# Altium schematic sheet DC116A_PwrMgmt.SchDoc: PwrMgmt
size 431 x 279 mm; Date: Not shown in title block; ApprovedBy: Not shown in title block; CheckedBy: Not shown in title block; Author: Not shown in title block; CompanyName: Not shown in title block; DrawnBy: Midhun Raveendran; Engineer: Midhun Raveendran; Organization: Not shown in title block; Address1: Not shown in title block; Address2: Not shown in title block; Address3: Not shown in title block; Address4: Not shown in title block; DocumentNumber: 6; Revision: Use project parameter SCH_Rev; SheetNumber: 6; SheetTotal: 8; PageSetup: Record=PageOptions|CenterHorizontal=True|CenterVertical=True|PrintScale=1.00|XCorrection=1.00|YCorrection=1.00|PrintKind=0|BorderSize=5000000|LeftOffset=0|BottomOffset=0|Orientation=2|PaperLength=1000|PaperWidth=1000|Scale=100|PaperSource=15|PrintQuality=600|MediaType=1|DitherType=10|PaperKind=Letter|PrintScaleMode=1; CurrentTime: Not shown in title block; CurrentDate: Not shown in title block; Time: Not shown in title block; DocumentFullPathAndName: Not shown in title block; DocumentName: Not shown in title block; ModifiedDate: Not shown in title block; ImagePath: Not shown in title block; ProjectName: DC057A
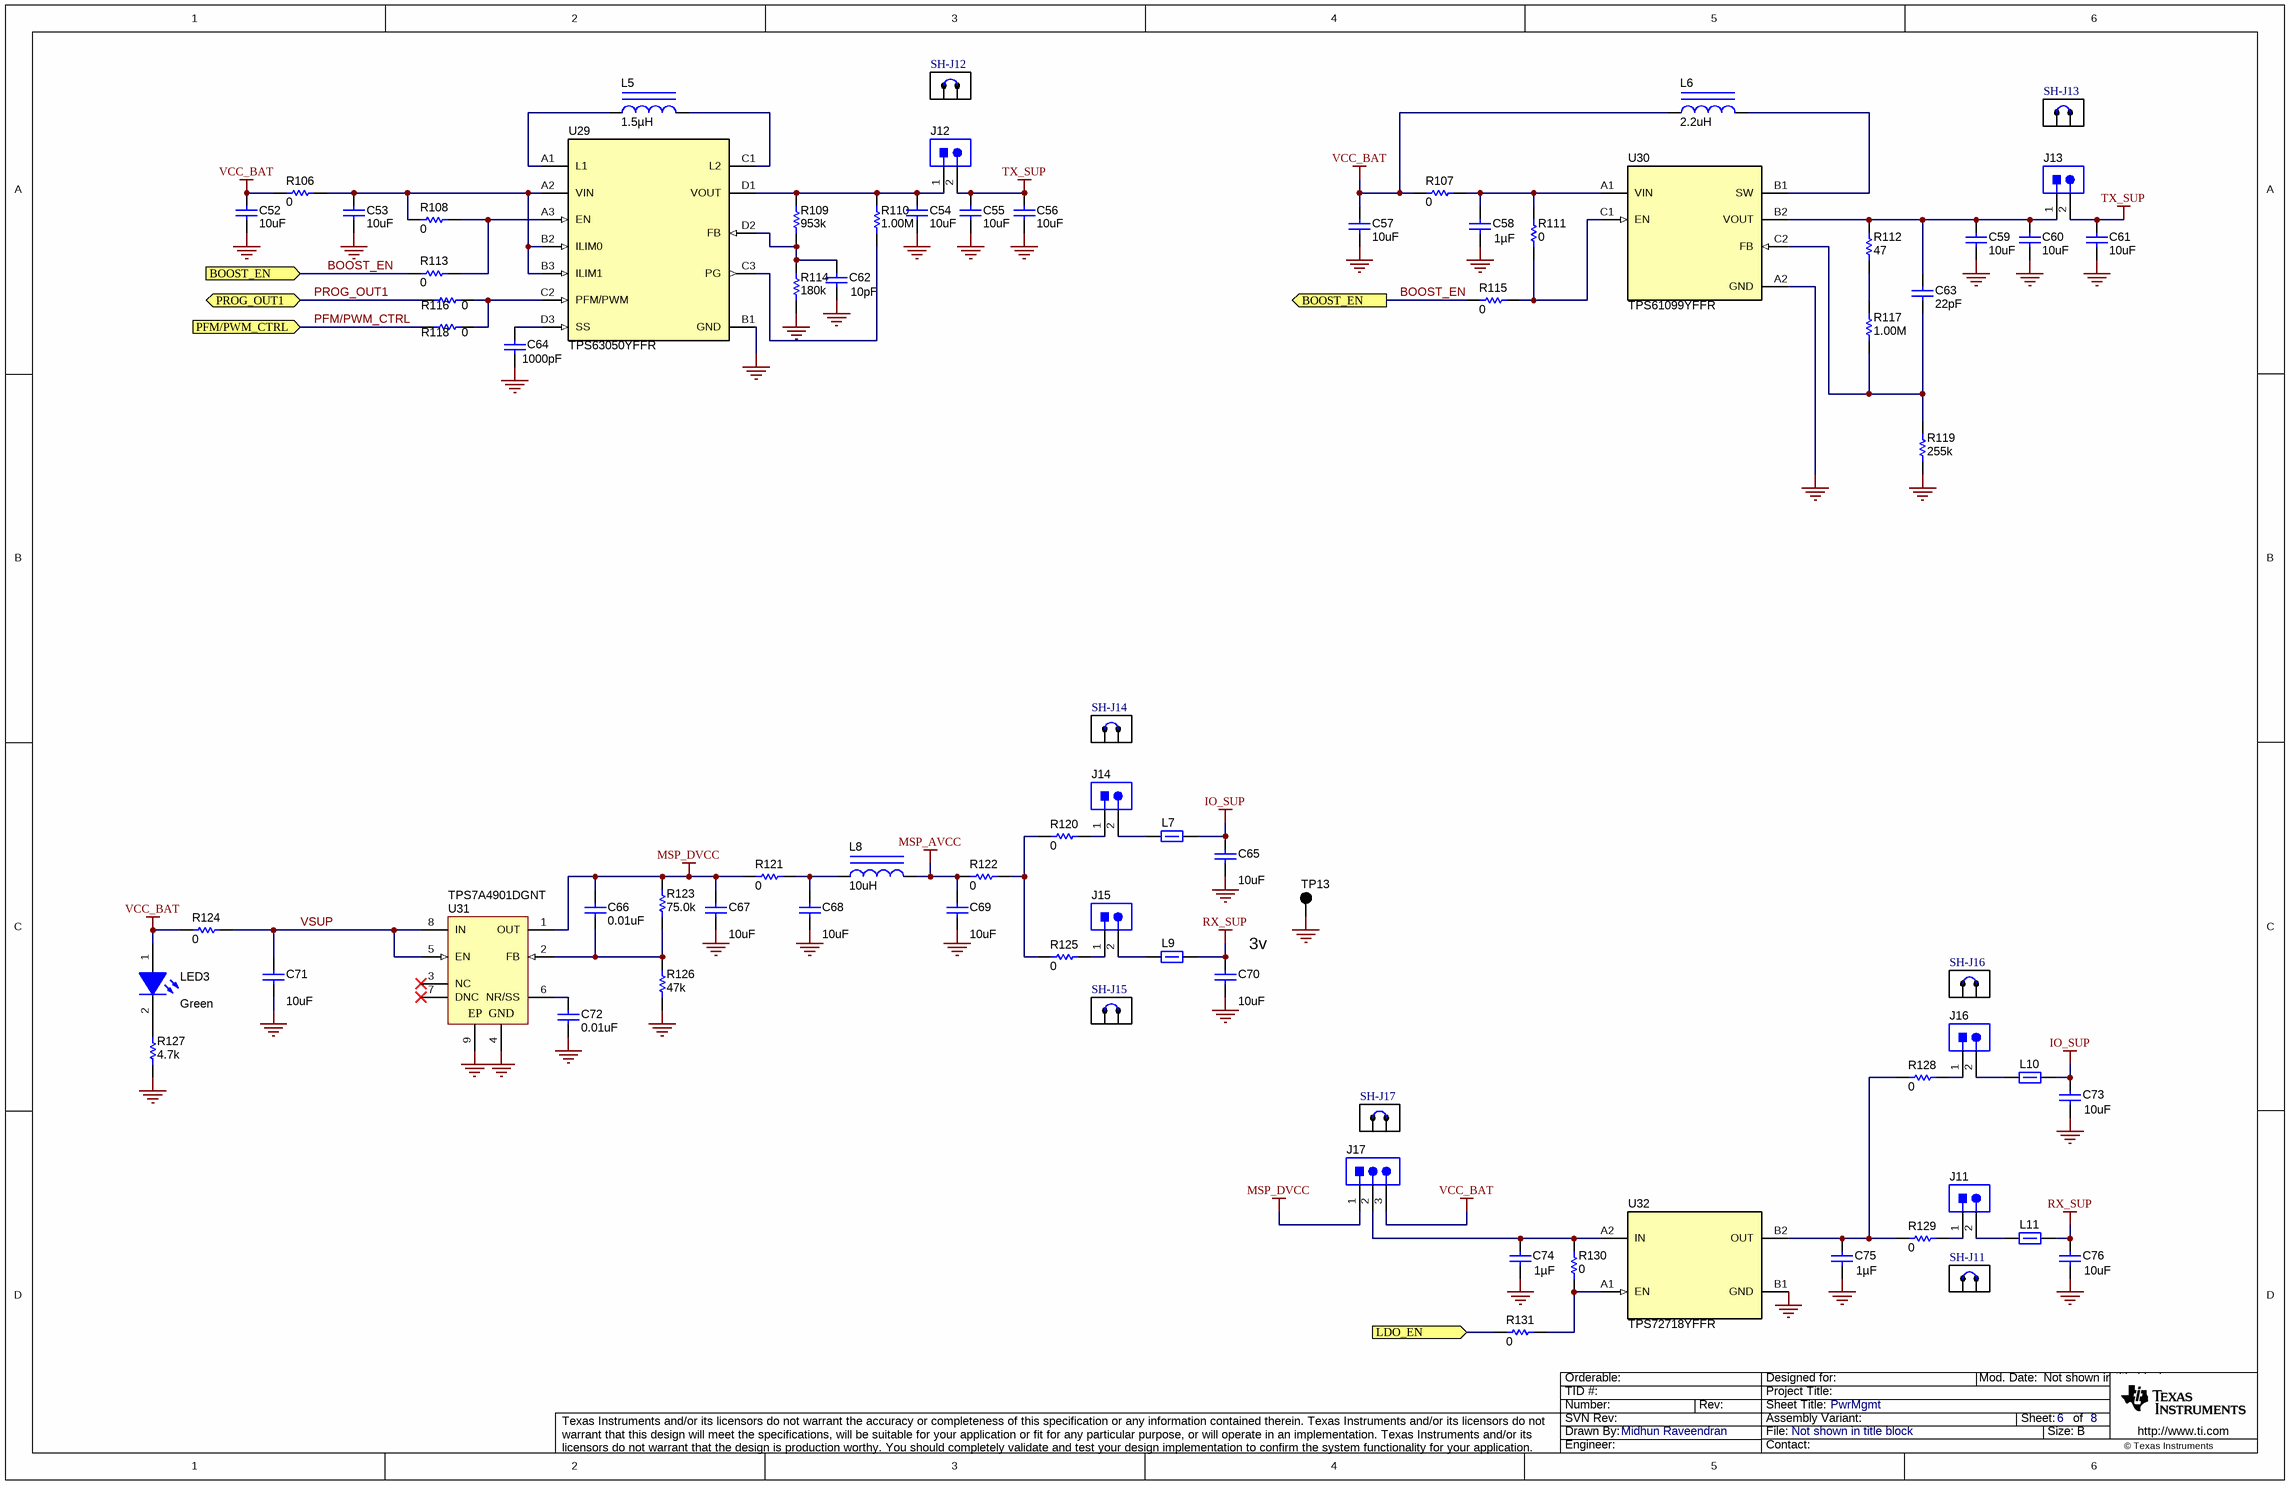
[diagram p0: DC116A_PwrMgmt.SchDoc]

## Parts
C52  ValueDisplayed: 10uF  [0603]  (hidden comment: Capacitor)
C53  ValueDisplayed: 10uF  [0603]  (hidden comment: Capacitor)
C54  ValueDisplayed: 10uF  [0603]  (hidden comment: Capacitor)
C55  ValueDisplayed: 10uF  [0603]  (hidden comment: Capacitor)
C56  ValueDisplayed: 10uF  [0603]  (hidden comment: Capacitor)
C57  ValueDisplayed: 10uF  [0603]  (hidden comment: Capacitor)
C58  ValueDisplayed: 1µF  [0603]  (hidden comment: TMK107BJ105KA-T)
C59  ValueDisplayed: 10uF  [0603]  (hidden comment: Capacitor)
C60  ValueDisplayed: 10uF  [0603]  (hidden comment: Capacitor)
C61  ValueDisplayed: 10uF  [0603]  (hidden comment: Capacitor)
C62  ValueDisplayed: 10pF  [0402]  (hidden comment: 500R07S100JV4T)
C63  ValueDisplayed: 22pF  [0603]  (hidden comment: AC0603JRNPOYBN220)
C64  ValueDisplayed: 1000pF  [0402]  (hidden comment: C1005X7R1H102M050BE)
C65  ValueDisplayed: 10uF  [0603]  (hidden comment: EMK107BBJ106MA-T)
C66  ValueDisplayed: 0.01uF  [0402]  (hidden comment: Capacitor)
C67  ValueDisplayed: 10uF  [0603]  (hidden comment: EMK107BBJ106MA-T)
C68  ValueDisplayed: 10uF  [0603]  (hidden comment: EMK107BBJ106MA-T)
C69  ValueDisplayed: 10uF  [0603]  (hidden comment: EMK107BBJ106MA-T)
C70  ValueDisplayed: 10uF  [0603]  (hidden comment: EMK107BBJ106MA-T)
C71  ValueDisplayed: 10uF  [0603]  (hidden comment: EMK107BBJ106MA-T)
C72  ValueDisplayed: 0.01uF  [0402]  (hidden comment: Capacitor)
C73  ValueDisplayed: 10uF  [0402_070]  (hidden comment: GRM155R60J106ME44D)
C74  ValueDisplayed: 1µF  [0603]  (hidden comment: TMK107BJ105KA-T)
C75  ValueDisplayed: 1µF  [0603]  (hidden comment: TMK107BJ105KA-T)
C76  ValueDisplayed: 10uF  [0402_070]  (hidden comment: GRM155R60J106ME44D)
J11  Header_2x1  [Samtec_TSW-102-07-T-S]  (value not drawn)
J12  Header_2x1  [Samtec_TSW-102-07-T-S]  (value not drawn)
J13  Header_2x1  [Samtec_TSW-102-07-T-S]  (value not drawn)
J14  Header_2x1  [Samtec_TSW-102-07-T-S]  (value not drawn)
J15  Header_2x1  [Samtec_TSW-102-07-T-S]  (value not drawn)
J16  Header_2x1  [Samtec_TSW-102-07-T-S]  (value not drawn)
J17  Header_3x1  [Samtec_TSW-103-07-T-S]  (value not drawn)
L5  ValueDisplayed: 1.5µH  [DFE201612C]  (hidden comment: Inductor_Iron)
L6  ValueDisplayed: 2.2uH  [WE_LQS_252012]  (hidden comment: Inductor_Iron)
L7  Ferrite_Bead  [0603]  (value not drawn)
L8  ValueDisplayed: 10uH  [LPS3010]  (hidden comment: Inductor_Iron)
L9  Ferrite_Bead  [0603]  (value not drawn)
L10  Ferrite_Bead  [0603]  (value not drawn)
L11  Ferrite_Bead  [0603]  (value not drawn)
LED3  value Green  [LED_SML-LX0603GW]  (hidden comment: LED)
R106  ValueDisplayed: 0  [0603]  (hidden comment: Resistor)
R107  ValueDisplayed: 0  [0603]  (hidden comment: Resistor)
R108  ValueDisplayed: 0  [0402]  (hidden comment: Resistor)
R109  ValueDisplayed: 953k  [0402]  (hidden comment: Resistor)
R110  ValueDisplayed: 1.00M  [0402]  (hidden comment: Resistor)
R111  ValueDisplayed: 0  [0402]  (hidden comment: Resistor)
R112  ValueDisplayed: 47  [0603]  (hidden comment: Resistor)
R113  ValueDisplayed: 0  [0402]  (hidden comment: Resistor)
R114  ValueDisplayed: 180k  [0402]  (hidden comment: Resistor)
R115  ValueDisplayed: 0  [0402]  (hidden comment: Resistor)
R116  ValueDisplayed: 0  [0402]  (hidden comment: Resistor)
R117  ValueDisplayed: 1.00M  [0603]  (hidden comment: Resistor)
R118  ValueDisplayed: 0  [0402]  (hidden comment: Resistor)
R119  ValueDisplayed: 255k  [0603]  (hidden comment: Resistor)
R120  ValueDisplayed: 0  [0603]  (hidden comment: Resistor)
R121  ValueDisplayed: 0  [0603]  (hidden comment: Resistor)
R122  ValueDisplayed: 0  [0603]  (hidden comment: Resistor)
R123  ValueDisplayed: 75.0k  [0402]  (hidden comment: Resistor)
R124  ValueDisplayed: 0  [0603]  (hidden comment: Resistor)
R125  ValueDisplayed: 0  [0603]  (hidden comment: Resistor)
R126  ValueDisplayed: 47k  [0402]  (hidden comment: Resistor)
R127  ValueDisplayed: 4.7k  [0402]  (hidden comment: Resistor)
R128  ValueDisplayed: 0  [0603]  (hidden comment: Resistor)
R129  ValueDisplayed: 0  [0603]  (hidden comment: Resistor)
R130  ValueDisplayed: 0  [0402]  (hidden comment: Resistor)
R131  ValueDisplayed: 0  [0402]  (hidden comment: Resistor)
SH-J11  881545-2  [TE_881545-2]  (value not drawn)
SH-J12  881545-2  [TE_881545-2]  (value not drawn)
SH-J13  881545-2  [TE_881545-2]  (value not drawn)
SH-J14  881545-2  [TE_881545-2]  (value not drawn)
SH-J15  881545-2  [TE_881545-2]  (value not drawn)
SH-J16  881545-2  [TE_881545-2]  (value not drawn)
SH-J17  881545-2  [TE_881545-2]  (value not drawn)
TP13  5001  [Keystone5001]  (value not drawn)
U29  PartNumber: TPS63050YFFR  [YFF0012AFAF]  (hidden comment: TPS6305x)
U30  PartNumber: TPS61099YFFR  [YFF0006AFAD]  (hidden comment: TPS61099YFF)
U31  PartNumber: TPS7A4901DGNT  [DGN0008D_N]  (hidden comment: TI-TPS7AXX01-YYDGN8-1760X1425TP)
U32  PartNumber: TPS72718YFFR  [YFF0004AUAB_A1]  (hidden comment: TPS727xxYFF)

## Ports
BOOST_EN (in), BOOST_EN (out), LDO_EN (in), PFM/PWM_CTRL (in), PROG_OUT1 (bidir)

## Nets
GND: C52.2 C53.2 C54.2 C55.2 C56.2 C57.2 C58.2 C59.2 C60.2 C61.2 C62.2 C64.2 C65.2 C67.2 C68.2 C69.2 C70.2 C71.2 C72.2 C73.2 C74.2 C75.2 C76.2 R114.1 R119.1 R126.2 R127.2 TP13.1 U29.B1(GND) U30.A2(GND) U31.4(GND) U31.9(EP) U32.B1(GND)
IO_SUP: C65.1 C73.1 L7.2 L10.2
MSP_AVCC: C69.1 L8.2 R122.1
MSP_DVCC: C66.1 C67.1 J17.1 R121.1 R123.2 U31.1(OUT)
RX_SUP: C70.1 C76.1 L9.2 L11.2
TX_SUP: C55.1 C56.1 C61.1 J12.2 J13.2
VCC_BAT: C52.1 C57.1 J17.3 L6.1 LED3.1(A) R106.2 R107.1 R124.1
BOOST_EN: R113.1 R115.1 ; port BOOST_EN
LDO_EN: R131.1 ; port LDO_EN
PFM/PWM_CTRL: R118.1 ; port PFM/PWM_CTRL
PROG_OUT1: R116.1 ; port PROG_OUT1
VSUP: C71.1 R124.2 U31.5(EN) U31.8(IN)
NetC53_1: C53.1 R106.1 R108.1 U29.A2(VIN) U29.B2(ILIM0) U29.B3(ILIM1)
NetC54_1: C54.1 J12.1 R109.2 R110.2 U29.D1(VOUT)
NetC58_1: C58.1 R107.2 R111.2 U30.A1(VIN)
NetC59_1: C59.1 C60.1 C63.1 J13.1 R112.2 U30.B2(VOUT)
NetC62_1: C62.1 R109.1 R114.2 U29.D2(FB)
NetC63_2: C63.2 R117.1 R119.2 U30.C2(FB)
NetC64_1: C64.1 U29.D3(SS)
NetC66_2: C66.2 R123.1 R126.1 U31.2(FB)
NetC68_1: C68.1 L8.1 R121.2
NetC72_1: C72.1 U31.6(NR/SS)
NetC74_1: C74.1 J17.2 R130.2 U32.A2(IN)
NetC75_1: C75.1 R128.1 R129.1 U32.B2(OUT)
NetJ11_1: J11.1 R129.2
NetJ11_2: J11.2 L11.1
NetJ14_1: J14.1 R120.2
NetJ14_2: J14.2 L7.1
NetJ15_1: J15.1 R125.2
NetJ15_2: J15.2 L9.1
NetJ16_1: J16.1 R128.2
NetJ16_2: J16.2 L10.1
NetL5_1: L5.1 U29.A1(L1)
NetL5_2: L5.2 U29.C1(L2)
NetL6_2: L6.2 U30.B1(SW)
NetLED3_2: LED3.2(K) R127.1
NetR108_2: R108.2 R113.2 U29.A3(EN)
NetR110_1: R110.1 U29.C3(PG)
NetR111_1: R111.1 R115.2 U30.C1(EN)
NetR112_1: R112.1 R117.2
NetR116_2: R116.2 R118.2 U29.C2(PFM/PWM)
NetR120_1: R120.1 R122.2 R125.1
NetR130_1: R130.1 R131.2 U32.A1(EN)

Not connected (* = marked no-connect by the designer): U31 3(NC)* 7(DNC)*

## Notes on the sheet
- 3v
- Drawn By:
- SVN Rev:
- Number:
- TID #:
- Orderable:
- Rev:
- Sheet Title:
- File:
- Project Title:
- Designed for:
- Assembly Variant:
- Mod. Date:
- Sheet:
- Size:
- of
- B
- http://www.ti.com
- Texas Instruments and/or its licensors do not warrant the accuracy or completeness of this specification or any information contained therein. Texas Instruments and/or its licensors do not warrant that this design will meet the specifications, will be suitable for your application or fit for any particular purpose, or will operate in an implementation. Texas Instruments and/or its licensors do not warrant that the design is production worthy. You should completely validate and test your design implementation to confirm the system functionality for your application.
- Engineer:
- Contact:
- © Texas Instruments

## Library data of the parts
C52 C53 = CMP-0007303-5: CAP, CERM, 10 uF, 6.3 V, +/- 20%, X5R, 0603; PartNumber: GRM188R60J106ME47D; Manufacturer: MuRata; Polarized: N; Value: 10uF; U/M: EA; Cap_F: 10µF; ESR_ohm: 9m; Value1: 0.009 ohm; VDC_V: 6.3V; IRMS_A: 2.74A; TaMin_C: -55°C; TaMax_C: 125°C; AEC Category: Q200; SizeArea_mm2: 1.28; SizeAreaWB_mm2: 4.68; SizeX_mm: 1.6; SizeY_mm: 0.8; SizeZ_mm: 1; CompType: Capacitor; PackageReference: 0603; RoHS: Y; Tolerance_%: 20%; Value2: 6.3V; MountType: SMT; Technology: Ceramic; TempCo: X5R; Cap_Case: 0603; Published: 2008-06-19; Publisher: Texas Instruments; LatestRevisionDate: 2017-03-09; ComponentLink1Description: Datasheet link; ComponentLink1URL: http://www.murata.com/products/capacitor/tech_data/pdf/grm188r60j106m.pdf; Supplier 1: Digi-Key; Supplier Part Number 1: 490-3896-1-ND; Supplier 2: Mouser; Supplier Part Number 2: 81-GRM188R60J106ME47; Supplier 3: Farnell; Supplier Part Number 3: 1735528; AEC Qualified: ?
C54-C57 C59-C61 = CMP-0007007-5: CAP, CERM, 10 uF, 25 V, +/- 20%, X5R, 0603; PartNumber: C1608X5R1E106M080AC; Manufacturer: TDK; Polarized: N; Value: 10uF; U/M: EA; Cap_F: 10µF; ESR_ohm: 4.639m; Value1: 0.004639 ohm; VDC_V: 25V; IRMS_A: 2.41407A; TaMin_C: -55°C; TaMax_C: 85°C; SizeArea_mm2: 1.28; SizeAreaWB_mm2: 4.68; SizeX_mm: 1.6; SizeY_mm: 0.8; SizeZ_mm: 1; AEC Category: Q200; CompType: Capacitor; PackageReference: 0603; RoHS: Y; Tolerance_%: 20%; Value2: 25V; MountType: SMT; Technology: Ceramic; TempCo: X5R; Cap_Case: 0603; Published: 2008-06-19; Publisher: Texas Instruments; LatestRevisionDate: 2017-03-09; ComponentLink1Description: Datasheet link; ComponentLink1URL: https://product.tdk.com/en/search/capacitor/ceramic/mlcc/info?part_no=C1608X5R1E106M080AC; Supplier 1: Digi-Key; Supplier Part Number 1: 445-9015-1-ND; Supplier 2: Newark; Supplier Part Number 2: 07W9179; Supplier 3: Mouser; Supplier Part Number 3: 810-C1608X5R1E106M; AEC Qualified: N; AEC Grade: N/A
C58 C74 C75 = CMP-0086152-1: CAP, CERM, 1 µF, 25 V,+/- 10%, X5R, 0603; Manufacturer: Taiyo Yuden; SizeAreaWB_mm2: 4.68; SizeZ_mm: 1; U/M: EA; Green_REACh: Passed; Value2: 25V; Value: 1uF; AEC Qualified: N; TaMax_C: 85°C; Green_Lifecycle: Active; AEC Category: Q200; SizeArea_mm2: 1.28; TaMin_C: -55°C; SizeY_mm: 0.8; SizeX_mm: 1.6; PackageReference: 0603; ComponentLink1URL: http://ds.yuden.co.jp/TYCOMPAS/ut/detail.do?productNo=TMK107BJ105KA-T&fileName=TMK107BJ105KA-T_SS&mode=specSheetDownload; Green_EU RoHS: Passed; Cap_F: 1µF; Tolerance_%: 10%; PartNumber: TMK107BJ105KA-T; MountType: SMT; VDC_V: 25V; Green_EU RoHS-2: Passed; Cap_Case: 0603; TempCo: X5R; ComponentLink1Description: Datasheet link; AEC Grade: N/A; RoHS: Y; CompType: Capacitor; Polarized: N; Technology: Ceramic
C62 = CMP-0006207-2: CAP, CERM, 10 pF, 50 V, +/- 5%, C0G/NP0, 0402; Manufacturer: Johanson Technology; TaMin_C: -55°C; Polarized: N; SizeAreaWB_mm2: 3; Value1: Unknown; U/M: EA; Value: 10pF; TaMax_C: 125°C; SizeZ_mm: 0.6; SizeX_mm: 1; SizeY_mm: 0.5; Value2: 50V; AEC Category: Q200; Publisher: Texas Instruments; TempCo: C0G/NP0; Published: 2008-06-19; RoHS: Y; MountType: SMT; PackageReference: 0402; Tolerance_%: 5%; Cap_Case: 0402; SizeArea_mm2: 0.5; CompType: Capacitor; LatestRevisionDate: 2017-03-09; PartNumber: 500R07S100JV4T; AEC Qualified: ?; Cap_F: 10pF; VDC_V: 50V; ComponentLink1Description: Datasheet link; Technology: Ceramic; ComponentLink1URL: http://www.johansontechnology.com/images/stories/catalog/JTI_CAT_2012_MLCC_HighQ.pdf
C63 = CMP-0080060-1: CAP, CERM, 22 pF, 250 V,+/- 5%, C0G/NP0, AEC-Q200 Grade 1, 0603; Manufacturer: Yageo America; TaMin_C: -55°C; Polarized: N; SizeAreaWB_mm2: 4.68; U/M: EA; Value: 22pF; TaMax_C: 125°C; SizeZ_mm: 1; SizeX_mm: 1.6; SizeY_mm: 0.8; Value2: 250V; SizeArea_mm2: 1.28; AEC Qualified: Y; AEC Category: Q200; ComponentLink1URL: http://www.yageo.com/documents/recent/UPY-AC_NP0X7R_16V-to-630V_8.pdf; Supplier Part Number 2: 603-AC603JRNPOYBN220; Supplier 2: Mouser; TempCo: C0G/NP0; RoHS: Y; MountType: SMT; Supplier 1: Digi-Key; PackageReference: 0603; Tolerance_%: 5%; Cap_Case: 0603; CompType: Capacitor; PartNumber: AC0603JRNPOYBN220; Cap_F: 22pF; VDC_V: 250V; ComponentLink1Description: Datasheet link; AEC Grade: 1; Supplier Part Number 1: 311-3095-1-ND; Technology: Ceramic
C64 = CMP-0006296-2: CAP, CERM, 1000 pF, 50 V, +/- 20%, X7R, 0402; Manufacturer: TDK; TaMin_C: -55°C; Polarized: N; SizeAreaWB_mm2: 3; Value1: Unknown; U/M: EA; Value: 1000pF; TaMax_C: 125°C; SizeZ_mm: 0.6; SizeX_mm: 1; SizeY_mm: 0.5; Value2: 50V; Cap_F: 1nF; AEC Category: Q200; Supplier Part Number 2: 92Y5760; Publisher: Texas Instruments; Supplier 2: Newark; Supplier Part Number 3: 810-C1005X7R1H102MBE; TempCo: X7R; Supplier 3: Mouser; Published: 2008-06-19; RoHS: Y; MountType: SMT; Supplier 1: Digi-Key; PackageReference: 0402; Tolerance_%: 20%; Cap_Case: 0402; SizeArea_mm2: 0.5; CompType: Capacitor; LatestRevisionDate: 2017-03-09; PartNumber: C1005X7R1H102M050BE; AEC Qualified: N; VDC_V: 50V; ComponentLink1Description: Datasheet link; AEC Grade: N/A; Supplier Part Number 1: 445-173775-1-ND; Technology: Ceramic; ComponentLink1URL: https://product.tdk.com/info/en/catalog/datasheets/mlcc_commercial_soft_en.pdf
C65 C67-C71 = CMP-0007122-5: CAP, CERM, 10 uF, 16 V, +/- 20%, X5R, 0603; Manufacturer: Taiyo Yuden; TaMin_C: -55°C; Polarized: N; SizeAreaWB_mm2: 4.68; Value1: Unknown; U/M: EA; Value: 10uF; TaMax_C: 85°C; SizeZ_mm: 1; SizeX_mm: 1.6; SizeY_mm: 0.8; Value2: 16V; SizeArea_mm2: 1.28; Cap_F: 10µF; AEC Category: Q200; Supplier Part Number 2: 963-EMK107BBJ106MA-T; Publisher: Texas Instruments; Supplier 2: Mouser; TempCo: X5R; Published: 2008-06-19; RoHS: Y; MountType: SMT; Supplier 1: Digi-Key; PackageReference: 0603; Tolerance_%: 20%; Cap_Case: 0603; CompType: Capacitor; LatestRevisionDate: 2017-03-09; PartNumber: EMK107BBJ106MA-T; AEC Qualified: ?; VDC_V: 16V; ComponentLink1Description: Datasheet link; Supplier Part Number 1: 587-3238-1-ND; Technology: Ceramic; ComponentLink1URL: http://ds.yuden.co.jp/TYCOMPAS/ut/detail.do?productNo=EMK107BBJ106MA-T&dataUnit=M
C66 C72 = CMP-0006355-2: CAP, CERM, 0.01 uF, 50 V, +/- 10%, C0G/NP0, 0402; PartNumber: GCM155R71H103KA55D; Manufacturer: MuRata; Polarized: N; Value: 0.01uF; U/M: EA; Cap_F: 10nF; Value1: Unknown; VDC_V: 50V; TaMin_C: -55°C; TaMax_C: 125°C; SizeArea_mm2: 0.5; SizeAreaWB_mm2: 3; SizeX_mm: 1; SizeZ_mm: 0.6; AEC Category: Q200; CompType: Capacitor; PackageReference: 0402; RoHS: Y; Tolerance_%: 10%; Value2: 50V; MountType: SMT; Technology: Ceramic; TempCo: C0G/NP0; Cap_Case: 0402; Published: 2008-06-19; Publisher: Texas Instruments; LatestRevisionDate: 2017-03-09; ComponentLink1Description: Datasheet link; ComponentLink1URL: http://psearch.en.murata.com/capacitor/product/GCM155R71H103KA55%23.pdf; Supplier 1: Digi-Key; Supplier Part Number 1: 490-4762-1-ND; Supplier 2: Mouser; Supplier Part Number 2: 81-GCM155R71H103KA5D; SizeY_mm: 0.5; AEC Qualified: ?
C73 C76 = CMP-0006535-2: CAP, CERM, 10 uF, 6.3 V, +/- 20%, X5R, 0402; Manufacturer: MuRata; TaMin_C: -55°C; Polarized: N; SizeAreaWB_mm2: 3; Value1: Unknown; U/M: EA; Value: 10uF; TaMax_C: 85°C; SizeZ_mm: 0.7; SizeX_mm: 1; SizeY_mm: 0.5; Cap_Case: 0402; Value2: 6.3V; Cap_F: 10µF; AEC Category: Q200; Publisher: Texas Instruments; TempCo: X5R; Published: 2008-06-19; RoHS: Y; MountType: SMT; Supplier 1: Mouser; PackageReference: 0402; Tolerance_%: 20%; SizeArea_mm2: 0.5; CompType: Capacitor; LatestRevisionDate: 2017-03-09; PartNumber: GRM155R60J106ME44D; AEC Qualified: ?; VDC_V: 6.3V; ComponentLink1Description: Datasheet link; Supplier Part Number 1: 81-GRM155R60J106ME4D; Technology: Ceramic; ComponentLink1URL: https://sps06.itg.ti.com/sites/KMS/crossdivteams/altium/docs/ComponentDatasheets/grm155r60j106me44d.pdf
J11-J16 = CMP-0075508-2: Header, 2.54 mm, 2x1, Tin, TH; PartNumber: TSW-102-07-T-S; Manufacturer: Samtec; Pitch_mm: 2.54; Gender: Male; Shrouded: N; Row_Count: 1; Current_A: 6.3A; Voltage_V: 550V; Cert_CSA: Y; Green_Lifecycle: Active; Green_REACh: Passed; PackageReference: Header, 2.54 mm, 2x1, TH; ClassName: Header; CompType: Header; RoHS: Y; MountType: TH; ComponentLink1Description: Datasheet URL; ComponentLink1URL: http://www.samtec.com/documents/webfiles/pdf/TSW_TH.PDF; Supplier 1: Digi-Key; Supplier Part Number 1: SAM1035-02-ND; Supplier 2: Newark; Supplier Part Number 2: 12P1261; Supplier 3: Farnell; Supplier Part Number 3: 2035681; Orientation: Vertical; PinCount: 2; ContactFinish: Tin; Color: Black; Cert_UL: Y; Cert_CULUS: N; Cert_VDE: N; Green_EU RoHS-2: Passed; Green_EU RoHS: Passed
J17 = CMP-0075530-2: Header, 2.54 mm, 3x1, Tin, TH; PartNumber: TSW-103-07-T-S; Manufacturer: Samtec; Pitch_mm: 2.54; Gender: Male; Shrouded: N; Row_Count: 1; Current_A: 6.3A; Voltage_V: 550V; Cert_CSA: Y; Green_Lifecycle: Active; Green_REACh: Passed; PackageReference: Header, 2.54 mm, 3x1, TH; ClassName: Header; CompType: Header; RoHS: Y; MountType: TH; ComponentLink1Description: Datasheet URL; ComponentLink1URL: http://www.samtec.com/ftppub/cpdf/TSW-XXX-XX-XXX-X-XX-XXX-MKT.pdf; Supplier 1: Digi-Key; Supplier Part Number 1: SAM1035-03-ND; Supplier 2: Newark; Supplier Part Number 2: 12P1325; Supplier 3: Farnell; Supplier Part Number 3: 2035682; Orientation: Vertical; PinCount: 3; ContactFinish: Tin; Color: Black; Cert_UL: Y; Cert_CULUS: N; Cert_VDE: N; Green_EU RoHS-2: Passed; Green_EU RoHS: Passed
L5 = CMP-0058917-2: Inductor, Wirewound, Powdered Iron, 1.5 µH, 1.8 A, 0.114 ohm, SMD; PartNumber: 1286AS-H-1R5M=P2; Manufacturer: MuRata; Value: 1.5uH; Imax_A: 1.8A; Irms: 1.8A @ 40C rise; Isat: 2A @ 30% inductance drop; DCR_ohm: 1.14d; AEC Category: Q200; AEC Qualified: N; SizeAreaWB_mm2: 8.96; SizeArea_mm2: 3.96; SizeX_mm: 2.2; SizeY_mm: 1.8; SizeZ_mm: 1.2; Green_Lifecycle: Not Set; Green_REACh: Incomplete; CompType: Inductor; Ind_H: 1.5µH; Value1: 0.114 ohm; Value2: 1.8A; Technology: Wirewound; MountType: SMT; Material: Powdered Iron; PackageReference: 2.0x1.2x1.6mm; Published: 2008-06-26; Publisher: Texas Instruments; LatestRevisionDate: 2017-08-04; ComponentLink1Description: Datasheet link; ComponentLink1URL: http://psearch.en.murata.com/inductor/product/1286AS-H-1R5M_.pdf; RoHS: Y; Supplier 1: Digi-Key; Supplier Part Number 1: 490-10604-1-ND; Supplier 2: Newark; Supplier Part Number 2: 81Y7599; Supplier 3: Mouser; Supplier Part Number 3: 81-1286AS-H-1R5MP2; AEC Grade: N/A; Green_EU RoHS-2: Incomplete; Green_EU RoHS: Incomplete
L6 = CMP-0063791-1: Inductor, Wirewound, Ferrite, 2.2 uH, 1.8 A, 0.08 ohm, SMD; PartNumber: 74404024022; Manufacturer: Wurth Elektronik; Value: 2.2uH; Ind_H: 2.2µH; Imax_A: 1.8A; Irms: 1.8A @ 40C rise; Isat: 1.95A @ 30% inductance drop; DCR_ohm: 0.08; AEC Category: Q200; AEC Qualified: N; SizeAreaWB_mm2: 10.5; SizeArea_mm2: 5; SizeX_mm: 2.5; SizeY_mm: 2; SizeZ_mm: 1.2; Green_Lifecycle: Active; Green_REACh: Passed; CompType: Inductor; Value1: 0.08 ohm; Value2: 1.8A; Technology: Wirewound; MountType: SMT; Material: Ferrite; PackageReference: SMD, 2.5x2mm; Published: 2008-06-26; Publisher: Texas Instruments; LatestRevisionDate: 2017-06-02; ComponentLink1Description: Datasheet link; ComponentLink1URL: http://katalog.we-online.de/pbs/datasheet/74404024022.pdf; RoHS: Y; Supplier 1: Digi-Key; Supplier Part Number 1: 732-5436-1-ND; Supplier 2: Newark; Supplier Part Number 2: 75X1095; Supplier 3: Mouser; Supplier Part Number 3: 710-74404024022; AEC Grade: N/A; Green_EU RoHS-2: Incomplete; Green_EU RoHS: Passed
L7 L9-L11 = CMP-0003344-2: Ferrite Bead, 120 ohm @ 100 MHz, 0.5 A, 0603; PartNumber: BLM18AG121SN1D; Manufacturer: MuRata; Value: 120 ohm; Imax_A: 5dA; DCR_ohm: 1.8d; Value1: 0.18 ohm; Value2: 0.5A; ZTyp@100MHz_Ohm: 120; SizeAreaWB_mm2: 4.68; SizeArea_mm2: 1.28; SizeX_mm: 1.6; SizeY_mm: 0.8; SizeZ_mm: 1; CompType: Ferrite Bead; MountType: SMT; PackageReference: 0603; Published: 2014-04-30; Publisher: Texas Instruments; LatestRevisionDate: 2017-03-09; ComponentLink1Description: Datasheet link; ComponentLink1URL: http://search.murata.co.jp/Ceramy/image/img/PDF/ENG/L0110S0100BLM18A.pdf; RoHS: Y; Ztyp@1GHz_Ohm: 120; Supplier 1: Digi-Key; Supplier Part Number 1: 490-1011-1-ND; Supplier 2: Newark; Supplier Part Number 2: 73M9051; Supplier 3: Mouser; Supplier Part Number 3: 81-BLM11A121S; ValueDisplayed: 120 ohm
L8 = CMP-0060433-1: Inductor, Shielded, Ferrite, 10 uH, 0.48 A, 0.54 ohm, SMD; PartNumber: LPS3010-103MRB; Manufacturer: Coilcraft; Value: 10uH; Ind_H: 10µH; Imax_A: 4.8dA; Irms: 0.48A @ 20C rise; Isat: 0.5A @ 10% inductance drop; DCR_ohm: 5.4d; Value2: 0.48A; SizeAreaWB_mm2: 15.6025; SizeArea_mm2: 8.7025; SizeX_mm: 2.95; SizeZ_mm: 0.9; AEC Category: Q200; Green_Lifecycle: Not Set; Green_REACh: Incomplete; CompType: Inductor; Value1: 0.54 ohm; Technology: Shielded; MountType: SMT; Material: Ferrite; PackageReference: LPS3010; Published: 2008-06-26; Publisher: Texas Instruments; LatestRevisionDate: 2017-06-02; ComponentLink1Description: Datasheet link; ComponentLink1URL: http://www.coilcraft.com/pdfs/lps3010.pdf; RoHS: Y; Supplier 1: Mouser; Supplier Part Number 1: 994-LPS3010-103MRB; Supplier 2: Farnell; Supplier Part Number 2: 2408002; SizeY_mm: 2.95; AEC Qualified: ?; Green_EU RoHS-2: Incomplete; Green_EU RoHS: Incomplete
LED3 = CMP-0002834-1: LED, Green, SMD; Manufacturer: Lumex; PartNumber: SML-LX0603GW-TR; Vf_V: 2.2V; Io_A: 20mA; Tjmax_C: 85°C; Value1: W; U/M: EA; CompType: LED; MountType: SMT; RoHS: Y; PackageReference: LED, GREEN, 0603; Type: ?; Value2: 2.2V; Color: green; Published: 2008-07-11; Publisher: Texas Instruments; ComponentLink1URL: http://www.lumex.com/specs/SML-LX0603GW-TR.pdf; ComponentLink1Description: Datasheet link; LatestRevisionDate: 2017-03-09; Supplier 1: Digi-Key; Supplier Part Number 1: 67-1549-1-ND; Supplier 2: Newark; Supplier Part Number 2: 75K1440; Supplier 3: Mouser; Supplier Part Number 3: 696-SML-LX0603GW
R106 R120-R122 R124 R125 = CMP-0025697-4: RES, 0, 5%, 0.1 W, AEC-Q200 Grade 0, 0603; PartNumber: CRCW06030000Z0EA; Manufacturer: Vishay-Dale; Value: 0; Value_Code: 0000; Power_W: 100mW; Value2: 0.1W; VDC_V: 75V; TempCo: 200 ppm/C; EIA_Code: E24; SizeArea_mm2: 1.28; SizeX_mm: 1.6; SizeY_mm: 0.8; SizeZ_mm: 1; AEC Category: Q200; AEC Qualified: Y; CompType: Resistor; PackageReference: 0603; RoHS: E; Res_ohm: 0; Tolerance_%: 5%; Value1: 5%; MountType: SMT; Technology: Thick Film; ComponentLink1Description: Datasheet link; ComponentLink1URL: http://www.vishay.com/docs/20035/dcrcwe3.pdf; Supplier 1: Digi-Key; Supplier Part Number 1: 541-0.0GCT-ND; Supplier 2: Newark; Supplier Part Number 2: 52K8014; Supplier 3: Mouser; Supplier Part Number 3: 71-CRCW0603-0-E3; AEC Grade: 0
R107 R128 R129 = CMP-0025874-4: RES, 0, 5%, 0.1 W, AEC-Q200 Grade 0, 0603; PartNumber: ERJ-3GEY0R00V; Manufacturer: Panasonic; Value: 0; Value_Code: 0000; Power_W: 100mW; Value2: 0.1W; VDC_V: 50V; TempCo: 600 ppm/C; SizeArea_mm2: 1.28; SizeX_mm: 1.6; SizeY_mm: 0.8; SizeZ_mm: 1; EIA_Code: E24; AEC Category: Q200; AEC Qualified: Y; SizeAreaWB_mm2: 4.68; CompType: Resistor; PackageReference: 0603; RoHS: Y; Res_ohm: 0; Tolerance_%: 5%; Value1: 5%; MountType: SMT; Technology: Thick Film; ComponentLink1Description: Datasheet link; ComponentLink1URL: https://industrial.panasonic.com/cdbs/www-data/pdf/RDA0000/AOA0000C301.pdf; Supplier 1: Digi-Key; Supplier Part Number 1: P0.0GCT-ND; Supplier 2: Mouser; Supplier Part Number 2: 667-ERJ-3GEY0R00V; Supplier 3: Farnell; Supplier Part Number 3: 2059527; AEC Grade: 0
R108 R113 R116 R118 = CMP-0026822-3: RES, 0, 5%, 0.063 W, AEC-Q200 Grade 0, 0402; PartNumber: CRCW04020000Z0ED; Manufacturer: Vishay-Dale; Value: 0; Value_Code: 0000; Power_W: 63mW; Value2: 0.063W; VDC_V: 50V; TempCo: 200 ppm/C; EIA_Code: E24; SizeArea_mm2: 0.5; SizeX_mm: 1; SizeZ_mm: 0.6; AEC Category: Q200; AEC Qualified: Y; CompType: Resistor; PackageReference: 0402; RoHS: E; Res_ohm: 0; Tolerance_%: 5%; Value1: 5%; MountType: SMT; Technology: Thick Film; ComponentLink1Description: Datasheet link; ComponentLink1URL: http://www.vishay.com/docs/20035/dcrcwe3.pdf; Supplier 1: Digi-Key; Supplier Part Number 1: 541-0.0JCT-ND; Supplier 2: Newark; Supplier Part Number 2: 52K6543; Supplier 3: Mouser; Supplier Part Number 3: 71-CRCW0402-0-E3; SizeY_mm: 0.5; AEC Grade: 0
R109 = CMP-0026611-3: RES, 953 k, 1%, 0.063 W, AEC-Q200 Grade 0, 0402; PartNumber: CRCW0402953KFKED; Manufacturer: Vishay-Dale; Value: 953k; Power_W: 63mW; Value2: 0.063W; VDC_V: 50V; TempCo: 100 ppm/C; EIA_Code: E96; AEC Category: Q200; AEC Qualified: Y; AEC Grade: 0; SizeArea_mm2: 0.5; SizeX_mm: 1; SizeZ_mm: 0.6; CompType: Resistor; PackageReference: 0402; RoHS: E; Res_ohm: 953k; Value_Code: 953k; Tolerance_%: 1%; Value1: 1%; MountType: SMT; Technology: Thick Film; ComponentLink1Description: Datasheet link; ComponentLink1URL: http://www.vishay.com/docs/20035/dcrcwe3.pdf; Supplier 1: Digi-Key; Supplier Part Number 1: 541-953KLCT-ND; Supplier 2: Newark; Supplier Part Number 2: 52K7351; Supplier 3: Mouser; Supplier Part Number 3: 71-CRCW0402-953K-E3; SizeY_mm: 0.5
R110 = CMP-0026100-2: RES, 1.00 M, 1%, 0.063 W, AEC-Q200 Grade 0, 0402; PartNumber: CRCW04021M00FKED; Manufacturer: Vishay-Dale; Value: 1.00Meg; Res_ohm: 1M; Value_Code: 1M00; Power_W: 63mW; Value2: 0.063W; VDC_V: 50V; TempCo: 100 ppm/C; EIA_Code: E96; AEC Category: Q200; AEC Qualified: Y; AEC Grade: 0; SizeArea_mm2: 0.5; SizeX_mm: 1; SizeZ_mm: 0.6; CompType: Resistor; PackageReference: 0402; RoHS: E; Tolerance_%: 1%; Value1: 1%; MountType: SMT; Technology: Thick Film; ComponentLink1Description: Datasheet link; ComponentLink1URL: http://www.vishay.com/docs/20035/dcrcwe3.pdf; Supplier 1: Digi-Key; Supplier Part Number 1: 541-1.00MLCT-ND; Supplier 2: Newark; Supplier Part Number 2: 52K6593; Supplier 3: Mouser; Supplier Part Number 3: 71-CRCW0402-1.0M-E3; SizeY_mm: 0.5
R111 R115 R130 R131 = CMP-0026822-3: RES, 0, 5%, 0.063 W, AEC-Q200 Grade 0, 0402; PartNumber: CRCW04020000Z0ED; Manufacturer: Vishay-Dale; Value: 0; Value_Code: 0000; Power_W: 63mW; Value2: 0.063W; VDC_V: 50V; TempCo: 200 ppm/C; SizeArea_mm2: 0.5; SizeX_mm: 1; SizeZ_mm: 0.6; EIA_Code: E24; AEC Category: Q200; AEC Qualified: Y; CompType: Resistor; PackageReference: 0402; RoHS: E; Res_ohm: 0; Tolerance_%: 5%; Value1: 5%; MountType: SMT; Technology: Thick Film; SizeY_mm: 0.5; ComponentLink1Description: Datasheet link; ComponentLink1URL: http://www.vishay.com/docs/20035/dcrcwe3.pdf; Supplier 1: Digi-Key; Supplier Part Number 1: 541-0.0JCT-ND; Supplier 2: Newark; Supplier Part Number 2: 52K6543; Supplier 3: Mouser; Supplier Part Number 3: 71-CRCW0402-0-E3; AEC Grade: 0
R112 = CMP-0025815-4: RES, 47, 5%, 0.1 W, AEC-Q200 Grade 0, 0603; PartNumber: CRCW060347R0JNEA; Manufacturer: Vishay-Dale; Value: 47; Value_Code: 47R0; Power_W: 100mW; Value2: 0.1W; VDC_V: 75V; TempCo: 200 ppm/C; SizeArea_mm2: 1.28; SizeX_mm: 1.6; SizeY_mm: 0.8; SizeZ_mm: 1; EIA_Code: E24; AEC Category: Q200; AEC Qualified: Y; AEC Grade: 0; CompType: Resistor; PackageReference: 0603; RoHS: E; Res_ohm: 47; Tolerance_%: 5%; Value1: 5%; MountType: SMT; Technology: Thick Film; ComponentLink1Description: Datasheet link; ComponentLink1URL: http://www.vishay.com/docs/20035/dcrcwe3.pdf; Supplier 1: Digi-Key; Supplier Part Number 1: 541-47GCT-ND; Supplier 2: Newark; Supplier Part Number 2: 52K8552; Supplier 3: Mouser; Supplier Part Number 3: 71-CRCW0603J-47-E3
R114 = CMP-0026848-2: RES, 180 k, 5%, 0.063 W, AEC-Q200 Grade 0, 0402; PartNumber: CRCW0402180KJNED; Manufacturer: Vishay-Dale; Value: 180k; Power_W: 63mW; Value2: 0.063W; VDC_V: 50V; TempCo: 200 ppm/C; EIA_Code: E24; AEC Category: Q200; AEC Qualified: Y; AEC Grade: 0; SizeArea_mm2: 0.5; SizeX_mm: 1; SizeZ_mm: 0.6; CompType: Resistor; PackageReference: 0402; RoHS: E; Res_ohm: 180k; Value_Code: 180k; Tolerance_%: 5%; Value1: 5%; MountType: SMT; Technology: Thick Film; ComponentLink1Description: Datasheet link; ComponentLink1URL: http://www.vishay.com/docs/20035/dcrcwe3.pdf; Supplier 1: Digi-Key; Supplier Part Number 1: 541-180KJCT-ND; Supplier 2: Newark; Supplier Part Number 2: 89M6615; Supplier 3: Mouser; Supplier Part Number 3: 71-CRCW0402J-180K-E3; SizeY_mm: 0.5
R117 = CMP-0022138-4: RES, 1.00 M, 1%, 0.1 W, AEC-Q200 Grade 0, 0603; PartNumber: CRCW06031M00FKEA; Manufacturer: Vishay-Dale; Value: 1.00Meg; Res_ohm: 1M; Value_Code: 1M00; Power_W: 100mW; Value2: 0.1W; VDC_V: 75V; TempCo: 100 ppm/C; SizeArea_mm2: 1.28; SizeX_mm: 1.6; SizeY_mm: 0.8; SizeZ_mm: 1; EIA_Code: E96; AEC Category: Q200; AEC Qualified: Y; AEC Grade: 0; CompType: Resistor; PackageReference: 0603; RoHS: E; Tolerance_%: 1%; Value1: 1%; MountType: SMT; Technology: Thick Film; ComponentLink1Description: Datasheet link; ComponentLink1URL: http://www.vishay.com/docs/20035/dcrcwe3.pdf; Supplier 1: Digi-Key; Supplier Part Number 1: 541-1.00MHCT-ND; Supplier 2: Newark; Supplier Part Number 2: 52K8053; Supplier 3: Mouser; Supplier Part Number 3: 71-CRCW0603-1.0M-E3
R119 = CMP-0022240-4: RES, 255 k, 1%, 0.1 W, AEC-Q200 Grade 0, 0603; PartNumber: CRCW0603255KFKEA; Manufacturer: Vishay-Dale; Value: 255k; Power_W: 100mW; Value2: 0.1W; VDC_V: 75V; TempCo: 100 ppm/C; SizeArea_mm2: 1.28; SizeX_mm: 1.6; SizeY_mm: 0.8; SizeZ_mm: 1; EIA_Code: E96; AEC Category: Q200; AEC Qualified: Y; AEC Grade: 0; CompType: Resistor; PackageReference: 0603; RoHS: E; Res_ohm: 255k; Value_Code: 255k; Tolerance_%: 1%; Value1: 1%; MountType: SMT; Technology: Thick Film; ComponentLink1Description: Datasheet link; ComponentLink1URL: http://www.vishay.com/docs/20035/dcrcwe3.pdf; Supplier 1: Digi-Key; Supplier Part Number 1: 541-255KHCT-ND; Supplier 2: Newark; Supplier Part Number 2: 52K8330; Supplier 3: Mouser; Supplier Part Number 3: 71-CRCW0603-255K-E3
R123 = CMP-0026543-2: RES, 75.0 k, 1%, 0.063 W, AEC-Q200 Grade 0, 0402; PartNumber: CRCW040275K0FKED; Manufacturer: Vishay-Dale; Value: 75.0k; Res_ohm: 75k; Value_Code: 75k0; Power_W: 63mW; Value2: 0.063W; VDC_V: 50V; TempCo: 100 ppm/C; EIA_Code: E96; SizeArea_mm2: 0.5; SizeX_mm: 1; SizeZ_mm: 0.6; AEC Category: Q200; AEC Qualified: Y; AEC Grade: 0; CompType: Resistor; PackageReference: 0402; RoHS: E; Tolerance_%: 1%; Value1: 1%; MountType: SMT; Technology: Thick Film; ComponentLink1Description: Datasheet link; ComponentLink1URL: http://www.vishay.com/docs/20035/dcrcwe3.pdf; Supplier 1: Digi-Key; Supplier Part Number 1: 541-75.0KLCT-ND; Supplier 2: Newark; Supplier Part Number 2: 52K7265; Supplier 3: Mouser; Supplier Part Number 3: 71-CRCW0402-75K-E3; SizeY_mm: 0.5
R126 = CMP-0026935-3: RES, 47 k, 5%, 0.063 W, AEC-Q200 Grade 0, 0402; PartNumber: CRCW040247K0JNED; Manufacturer: Vishay-Dale; Value: 47k; Value_Code: 47k0; Power_W: 63mW; Value2: 0.063W; VDC_V: 50V; TempCo: 200 ppm/C; EIA_Code: E24; SizeArea_mm2: 0.5; SizeX_mm: 1; SizeZ_mm: 0.6; AEC Category: Q200; AEC Qualified: Y; AEC Grade: 0; CompType: Resistor; PackageReference: 0402; RoHS: E; Res_ohm: 47k; Tolerance_%: 5%; Value1: 5%; MountType: SMT; Technology: Thick Film; ComponentLink1Description: Datasheet link; ComponentLink1URL: http://www.vishay.com/docs/20035/dcrcwe3.pdf; Supplier 1: Digi-Key; Supplier Part Number 1: 541-47KJCT-ND; Supplier 2: Newark; Supplier Part Number 2: 52K7099; Supplier 3: Mouser; Supplier Part Number 3: 71-CRCW0402-J-47K-E3; SizeY_mm: 0.5
R127 = CMP-0026938-5: RES, 4.7 k, 5%, 0.063 W, AEC-Q200 Grade 0, 0402; PartNumber: CRCW04024K70JNED; Manufacturer: Vishay-Dale; Value: 4.7k; Value_Code: 4k70; Power_W: 63mW; Value2: 0.063W; VDC_V: 50V; TempCo: 200 ppm/C; EIA_Code: E24; SizeArea_mm2: 0.5; SizeX_mm: 1; SizeZ_mm: 0.6; AEC Category: Q200; AEC Qualified: Y; AEC Grade: 0; CompType: Resistor; PackageReference: 0402; RoHS: E; Res_ohm: 4.7k; Tolerance_%: 5%; Value1: 5%; MountType: SMT; Technology: Thick Film; ComponentLink1Description: Datasheet link; ComponentLink1URL: http://www.vishay.com/docs/20035/dcrcwe3.pdf; Supplier 1: Digi-Key; Supplier Part Number 1: 541-4.7KJCT-ND; Supplier 2: Newark; Supplier Part Number 2: 59M6733; Supplier 3: Mouser; Supplier Part Number 3: 71-CRCW0402J-4.7K-E3; SizeY_mm: 0.5
SH-J11-SH-J17 = CMP-0003677-2: Shunt, 100mil, Gold plated, Black; Manufacturer: TE Connectivity; ComponentLink1URL: http://www.te.com/commerce/DocumentDelivery/DDEController?Action=srchrtrv&DocNm=881545&DocType=Customer+Drawing&DocLang=English; Key: 881545-2; Publisher: Texas Instruments; Supplier Part Number 2: 26H2523; Supplier 3: Mouser; Supplier 1: Digi-Key; CompType: Shunt; PackageReference: Shunt 2 pos. 100 mil; LatestRevisionDate: 2017-03-09; RoHS: Y; Supplier Part Number 1: A26242-ND; Supplier Part Number 3: 571-8815452; Supplier 2: Newark; MountType: N/A; PartNumber: 881545-2; ComponentLink1Description: Datasheet Link
TP13 = CMP-0055138-1: Test Point, Miniature, Black, TH; Manufacturer: Keystone; ContactFinish: Silver; CNHeader: FALSE; CT: TRUE; Green_Lifecycle: Active; Green_REACh: Passed; PartNumber: 5001; PackageReference: Black Miniature Testpoint; CompType: Test Point; RoHS: Y; MountType: TH; ComponentLink1Description: Datasheet URL; ComponentLink1URL: http://www.keyelco.com/userAssets/file/M60-2p60.pdf; Publisher: Texas Instruments; LatestRevisionDate: 26/05/2017; Supplier 1: Digi-Key; Supplier Part Number 1: 36-5001-ND; Supplier 2: Mouser; Supplier Part Number 2: 534-5001; Color: Black; Green_EU RoHS-2: Incomplete; Green_EU RoHS: Passed
U29 = CMP-0066970-1: Tiny Single Inductor Buck Boost Converter, YFF0012AFAF (DSBGA-12); Alternate PartNumber: TPS63050YFFT; Manufacturer: Texas Instruments; CompType: IC; U/M: EA; SizeArea_mm2: 2.168196; SizeAreaWB_mm2: 6.140196; SizeX_mm: 1.686; SizeY_mm: 1.286; SizeZ_mm: 0.625; Green_Lifecycle: Active; Green_REACh: Passed; PackageReference: YFF0012AFAF; MountType: SMT; ComponentLink1Description: Datasheet Link; ComponentLink1URL: http://www.ti.com/lit/ds/symlink/tps63050.pdf; RoHS: Y; Publisher: Texas Instruments; LatestRevisionDate: 2017-06-09; Alternate Manufacturer: Texas Instruments; PackageDescription: DSBGA-12; Footprint Path 6: C:\AltiumLibraries\Footprints\TI\.PcbLib; Green_EU RoHS-2: Passed; Green_EU RoHS: Passed
U30 = CMP-0074075-1: Synchronous Boost Converter with 800 nA Ultra-Low Quiescent Current, YFF0006AFAD (DSBGA-6); Alternate PartNumber: TPS61099YFFT; Manufacturer: Texas Instruments; SizeArea_mm2: 1.083784; SizeAreaWB_mm2: 4.193784; SizeX_mm: 0.884; SizeY_mm: 1.226; SizeZ_mm: 0.625; CompType: IC; U/M: EA; PackageReference: YFF0006AFAD; PackageDescription: DSBGA-6; MountType: SMT; ComponentLink1Description: Datasheet Link; ComponentLink1URL: http://www.ti.com/lit/ds/symlink/tps61099.pdf; Publisher: Texas Instruments; LatestRevisionDate: 2017-06-09; Alternate Manufacturer: Texas Instruments; Footprint Path 6: C:\AltiumLibraries\Footprints\TI\.PcbLib
U31 = CMP-0035927-1: Single Output High PSRR LDO, 150 mA, Adjustable 1.2 to 33 V Output, 3 to 36 V Input, with Ultra-Low Noise, 8-pin MSOP (DGN), -40 to 125 degC, Green (RoHS & no Sb/Br); Manufacturer: Texas Instruments; Accuracy(%): 1.5; Iout(Max)(A): 0.15; Iq(Typ)(mA): 0.06; Power Good: TRUE; SubFamily: Single Channel LDO; Vdo(Typ)(mV): 260; Vin(Max)(V): 36; Vin(Min)(V): 3; Vout Adj(Max)(V): 33; Vout Adj(Min)(V): 1.2; DatasheetVersion: SBVS121B; PackageVersion: 4073271/F; PackageReference: DGN0008D; PackageDescription: 8-pin Plastic Small Outline, Body 3 x 3 mm, Pitch 0.65 mm; Eco-Plan: Green (RoHS & no Sb/Br); Code_JEDEC: MO-187; ComponentLink1Description: Manufacturer URL; ComponentLink1URL: http://www.ti.com/; ComponentLink2Description: Datasheet; ComponentLink2URL: http://www.ti.com/general/docs/lit/getliterature.tsp?genericPartNumber=TPS7A4901&fileType=pdf; ComponentLink3Description: Package Specification; ComponentLink3URL: http://www.ti.com/litv/pdf/mpds046e; Mounting Technology: Surface Mount
U32 = CMP-0073812-1: 250-mA, Ultralow IQ, Fast Transient Response, RF Low-Dropout Linear Regulator, YFF0004AUAB_A1 (DSBGA-4); Alternate PartNumber: TPS72718YFFT; Manufacturer: Texas Instruments; SizeArea_mm2: 0.9164; SizeAreaWB_mm2: 3.8664; SizeX_mm: 0.79; SizeY_mm: 1.16; SizeZ_mm: 0.625; CompType: IC; U/M: EA; PackageReference: YFF0004AUAB_A1; PackageDescription: DSBGA-4; MountType: SMT; ComponentLink1Description: Datasheet Link; ComponentLink1URL: http://www.ti.com/lit/ds/symlink/tps727.pdf; RoHS: Y; Publisher: Texas Instruments; LatestRevisionDate: 2017-06-09; Alternate Manufacturer: Texas Instruments; Footprint Path 6: C:\AltiumLibraries\Footprints\TI\.PcbLib